# EAGLE design EC_AMPLIFIER_BENCHTOP_V.1.1.1 (EAGLE 9.6.2)
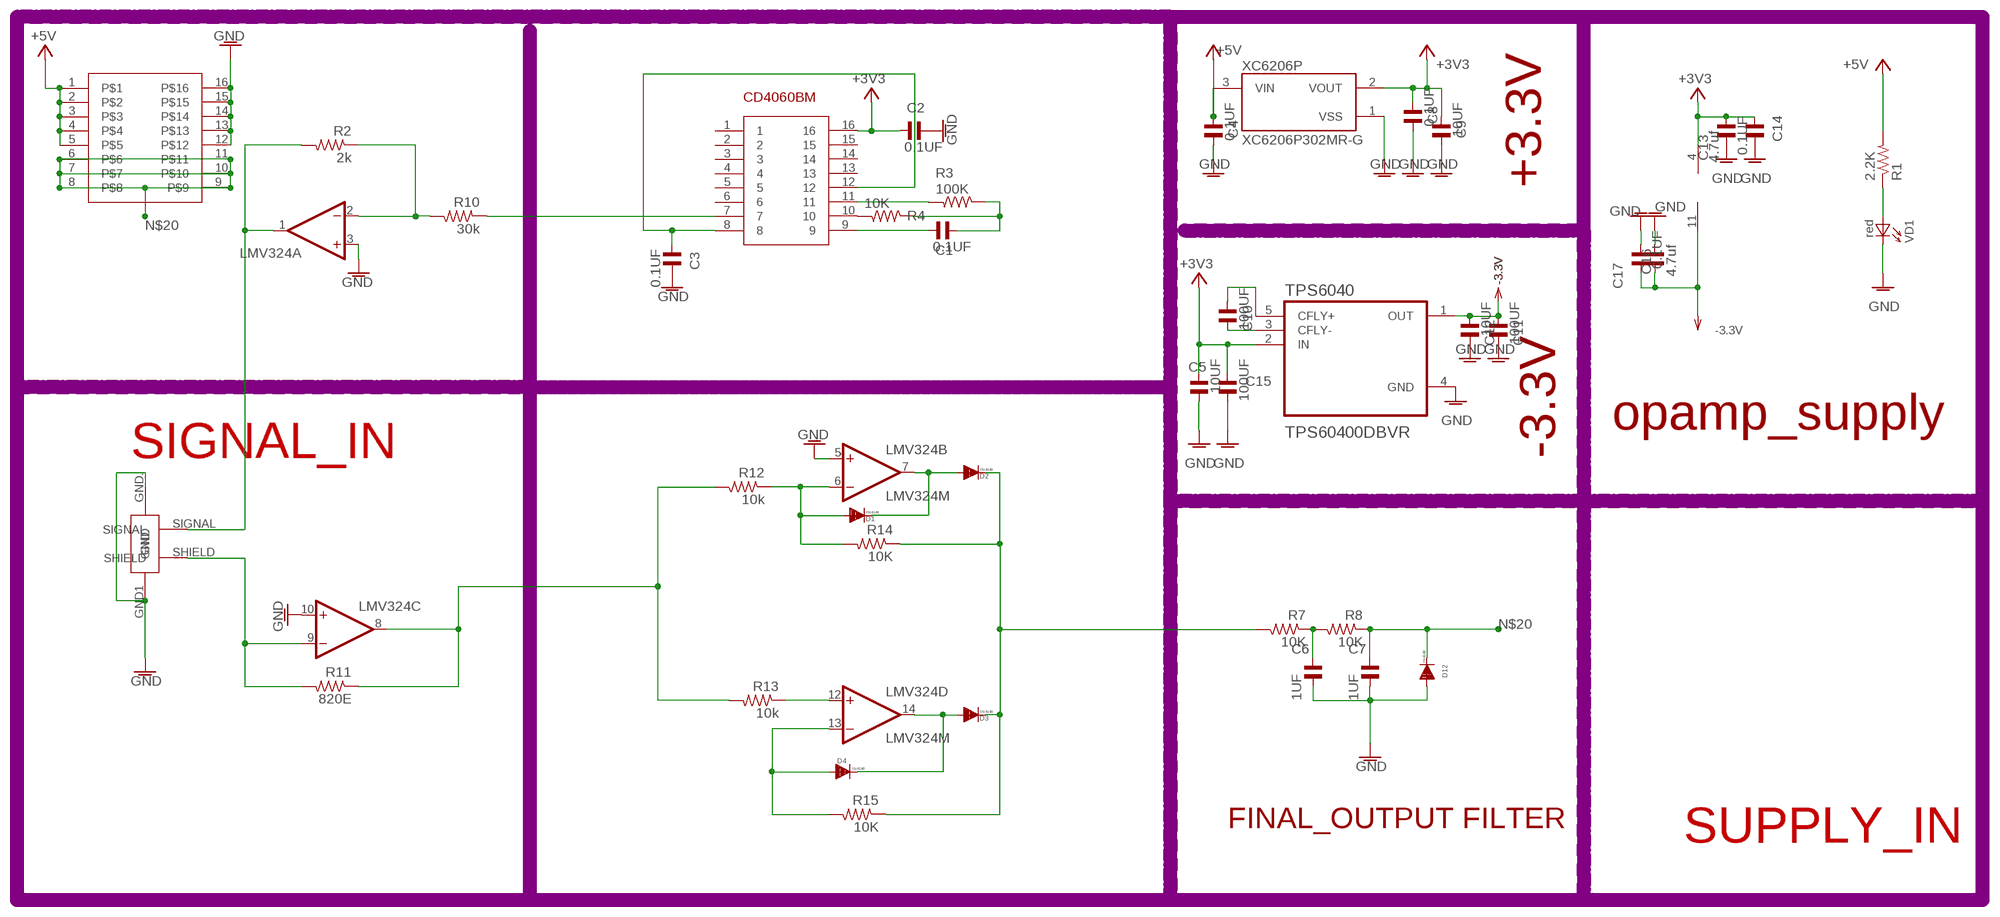
[diagram p0: schematic, sheet 1]

## Parts
C1  0.1UF  C-USC0805K  [C0805K]
C2  0.1UF  C-USC0805K  [C0805K]
C3  0.1UF  C-USC0805K  [C0805K]
C4  0.1UF  C-USC0805K  [C0805K]
C5  10UF  C-USC0805K  [C0805K]
C6  1UF  C-USC0805K  [C0805K]
C7  1UF  C-USC0805K  [C0805K]
C8  0.1UF  C-USC0805K  [C0805K]
C9  10UF  C-USC0805K  [C0805K]
C10  100UF  C-USC0805K  [C0805K]
C11  100UF  C-USC0805K  [C0805K]
C12  10UF  C-USC0805K  [C0805K]
C13  4.7uf  C-USC0805K  [C0805K]
C14  0.1UF  C-USC0805K  [C0805K]
C15  100UF  C-USC0805K  [C0805K]
C16  4.7uf  C-USC0805K  [C0805K]
C17  0.1UF  C-USC0805K  [C0805K]
CD4060BM  CD4060BM  [SOIC-16]
D1  IN4148  DIODE80  [SOD-80]
D2  IN4148  DIODE80  [SOD-80]
D3  IN4148  DIODE80  [SOD-80]
D4  IN4148  DIODE80  [SOD-80]
D12  IN4148  DIODE80  [SOD-80]
LMV324  LMV324M  [SO14]
R1  2.2K  R-US_M0805  [M0805]
R2  2k  R-US_M0805  [M0805]
R3  100K  R-US_M0805  [M0805]
R4  10K  R-US_M0805  [M0805]
R7  10K  R-US_M0805  [M0805]
R8  10K  R-US_M0805  [M0805]
R10  30k  R-US_M0805  [M0805]
R11  820E  R-US_M0805  [M0805]
R12  10k  R-US_M0805  [M0805]
R13  10k  R-US_M0805  [M0805]
R14  10K  R-US_M0805  [M0805]
R15  10K  R-US_M0805  [M0805]
TPS6040  TPS60400DBVR  [SOT95P280X145-5N]
U$2  AMPLIFIER_BENCHTOP  [AMPLIFIER_BENCHTOP]
U$3  BNC_RIGHTANGLE  [BNC_RIGHTANGLE]
VD1  red  LED1206  [LED-1206]
XC6206P  XC6206P302MR-G  [SOT95P280X130-3N]

## Nets
+3V3: C2.1 C5.2 C8.2 C9.2 C13.2 C14.2 C15.2 CD4060BM.16 LMV324.4(P:V+) TPS6040.2(IN) XC6206P.2(VOUT)
+5V: C4.2 R1.2 U$2.1 U$2.2 U$2.3 U$2.4 U$2.5 XC6206P.3(VIN)
-5V: C11.2 C12.2 C16.1 C17.1 LMV324.11(P:V-) TPS6040.1(OUT) ; supply symbol labelled -3.3V
GNDA: C2.2 C3.2 C4.1 C5.1 C6.2 C7.2 C8.1 C9.1 C11.1 C12.1 C13.1 C14.1 C15.1 C16.2 C17.2 D12.A LMV324.3(A:+IN) LMV324.5(B:+IN) LMV324.10(C:+IN) TPS6040.4(GND) U$2.12 U$2.13 U$2.14 U$2.15 U$2.16 U$3.GND1(GND.) U$3.GND.(GND) VD1.C XC6206P.1(VSS) ; supply symbol labelled GND
N$1: LMV324.2(A:-IN) R2.1 R10.2
N$2: C10.2 TPS6040.5(CFLY+)
N$3: C10.1 TPS6040.3(CFLY-)
N$4: C6.1 R7.1 R8.2
N$5: C3.1 CD4060BM.8 CD4060BM.12
N$6: CD4060BM.7 R10.1
N$7: CD4060BM.11 R3.1
N$8: R1.1 VD1.A
N$9: CD4060BM.10 R4.1
N$10: LMV324.9(C:-IN) R11.2 U$3.SHIELD
N$14: LMV324.8(C:OUT) R11.1 R12.2 R13.2
N$15: C1.1 CD4060BM.9
N$16: C1.2 R3.2 R4.2
N$17: LMV324.1(A:OUT) R2.2 U$3.SIGNAL
N$18: D1.A LMV324.6(B:-IN) R12.1 R14.2
N$19: LMV324.12(D:+IN) R13.1
N$20: C7.1 D12.K R8.1 U$2.6 U$2.7 U$2.8 U$2.9 U$2.10 U$2.11
N$21: D1.K D2.A LMV324.7(B:OUT)
N$22: D4.A LMV324.13(D:-IN) R15.2
N$23: D3.A D4.K LMV324.14(D:OUT)
N$25: D2.K D3.K R7.2 R14.1 R15.1
Unconnected: CD4060BM.1 CD4060BM.2 CD4060BM.3 CD4060BM.4 CD4060BM.5 CD4060BM.6 CD4060BM.13 CD4060BM.14 CD4060BM.15

## Notes on the sheet
- +3.3V
- opamp_supply
- SIGNAL_IN | -3.3V
- FINAL_OUTPUT FILTER
- SUPPLY_IN

## Library data of the parts
C1-C17 = rcl:C-US: CAPACITOR, American symbol
CD4060BM = Squadron:CD4060BM
D1-D4 D12 = Squadron:DIODE
LMV324 = linear:LMV324?*: Quad General Purpose, Low Voltage, Rail-to-Rail Output Operational Amplifiers Source: http://www.national.com/mpf/LM/LMV321.html http://www.national.com/dt/lmv_qual.pdf
R1-R4 R7 R8 R10-R15 = rcl:R-US_: RESISTOR, American symbol
TPS6040 = TPS60400DBVR:TPS60400DBVR
U$2 = Squadron:AMPLIFIER_BENCHTOP
U$3 = Squadron:BNC_RIGHTANGLE
VD1 = led:LED: LEDs SMD Leds
XC6206P = XC6206P302MR-G:XC6206P302MR-G: Linear Voltage Regulator IC 1 Output 200mA SOT-23; MANUFACTURER: Torex; MAXIMUM_PACKAGE_HEIGHT: 1.3mm; PARTREV: N/A; STANDARD: IPC-7351B

## Board
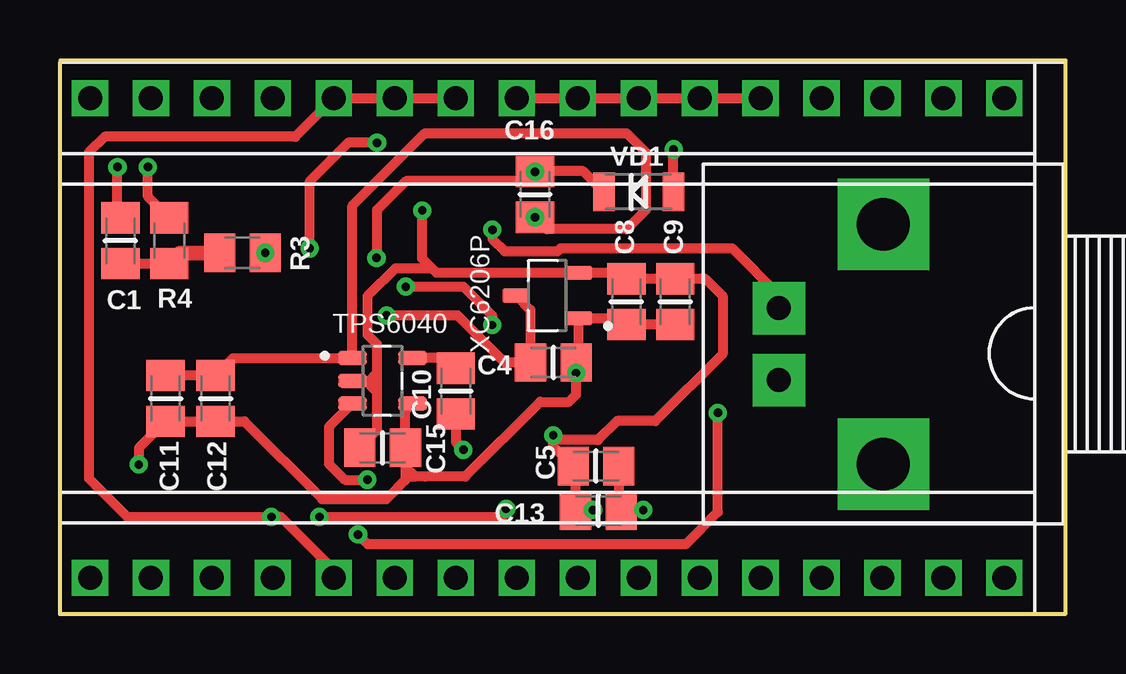
[diagram p1: board, top side]
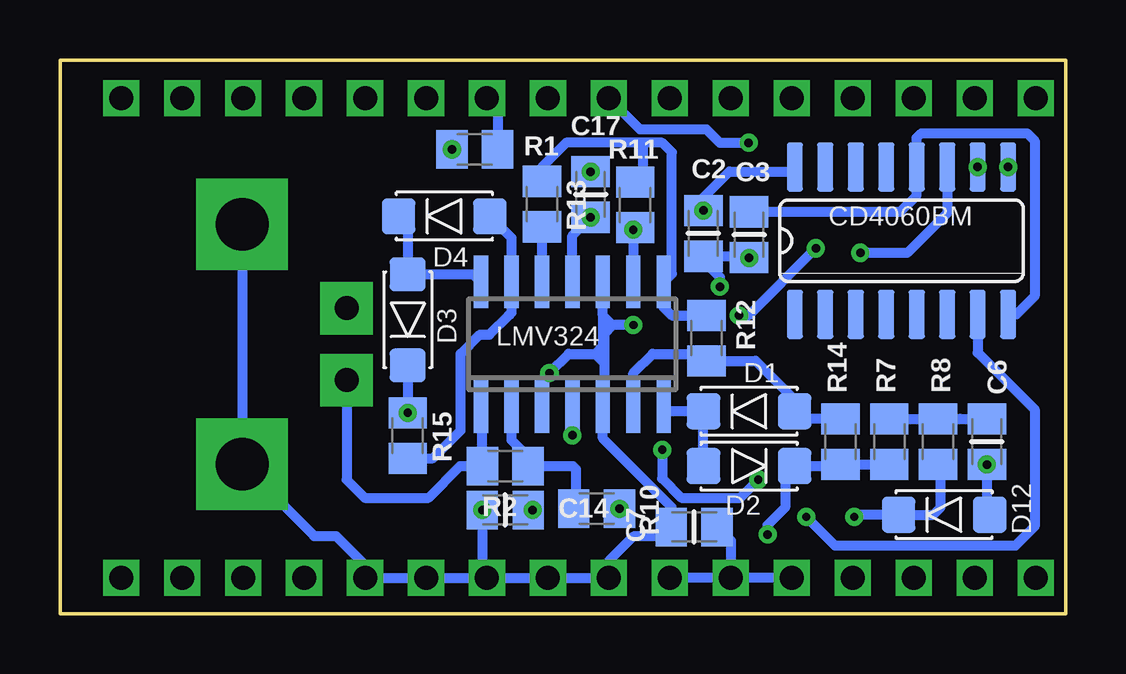
[diagram p2: board, bottom side, seen from below]

Size 41.9 x 23.1 mm. Coordinates in mm from the lower left corner, seen from the top.
Copper layers (1*16): Top 0.035mm / dielectric 1.5mm / Bottom 0.035mm
Design rules "default *": minimum track width 6mil, minimum drill 0.35mm, track to track 10mil, track to pad 10mil, pad to pad 10mil, via to via 10mil, smd to smd 10mil, copper to edge 40mil, drill to drill 10mil, minimum pad ring 10mil, minimum via ring 8mil, stop-mask expansion 4mil, vias tented up to drill 0mil, thermal gap 10mil

### Footprints (pad centres in the part's own frame; a part is rotated, then mirrored left to right if it is on the bottom)
C0805K = smd 1.3 x 1.6: 1 -0.953,0; 2 0.953,0
SOIC-16 = smd 0.66 x 2.032: 1 -4.445,-3.073; 2 -3.175,-3.073; 3 -1.905,-3.073; 4 -0.635,-3.073; 5 0.635,-3.073; 6 1.905,-3.073; 7 3.175,-3.073; 8 4.445,-3.073; 9 4.445,3.073; 10 3.175,3.073; 11 1.905,3.073; 12 0.635,3.073; 13 -0.635,3.073; 14 -1.905,3.073; 15 -3.175,3.073; 16 -4.445,3.073
SOD-80 = smd 1.4 x 1.5: A -1.9,0; K 1.9,0
SO14 = smd 0.6 x 2.2: 1 -3.81,-2.6; 2 -2.54,-2.6; 3 -1.27,-2.6; 4 0,-2.6; 5 1.27,-2.6; 6 2.54,-2.6; 7 3.81,-2.6; 8 3.81,2.6; 9 2.54,2.6; 10 1.27,2.6; 11 0,2.6; 12 -1.27,2.6; 13 -2.54,2.6; 14 -3.81,2.6
M0805 = smd 1.3 x 1.6: 1 -0.95,0; 2 0.95,0
SOT95P280X145-5N = smd 1.21 x 0.59: 1 -1.255,0.95; 2 -1.255,0; 3 -1.255,-0.95; 4 1.255,-0.95; 5 1.255,0.95
AMPLIFIER_BENCHTOP = drill 1 square: 1 -10,8.89; 2 -10,6.35; 3 -10,3.81; 4 -10,1.27; 5 -10,-1.27; 6 -10,-3.81; 7 -10,-6.35; 8 -10,-8.89; 9 10,-8.89; 10 10,-6.35; 11 10,-3.81; 12 10,-1.27; 13 10,1.27; 14 10,3.81; 15 10,6.35; 16 10,8.89; 17 -10,11.43; 18 -10,13.97; 19 -10,16.51; 20 -10,19.05; 21 10,11.43; 22 10,13.97; 23 10,16.51; 24 10,19.05; 25 10,-11.43; 26 10,-13.97; 27 10,-16.51; 28 10,-19.05; 29 -10,-11.43; 30 -10,-13.97; 31 -10,-16.51; 32 -10,-19.05
BNC_RIGHTANGLE = drill 2.2 pad 3.81 square: GND1 -5,0; GND. 5,0 | drill 1 pad 2.184 square: SHIELD 1.5,4.35; SIGNAL -1.5,4.35
LED-1206 = smd 0.9 x 1.6: A -1.45,0; C 1.45,0
SOT95P280X130-3N = smd 1.12 x 0.6: 1 -1.3,0.95; 2 -1.3,-0.95; 3 1.3,0

### Placement (x,y rotation side)
C1  2.52,15.56 270 top
C2  15.09,15.87 270 bottom
C3  13.19,15.82 270 bottom
C4  20.55,10.48 180 top
C5  22.33,6.17 180 top
C6  3.28,7.18 270 bottom
C7  15.47,3.63 180 bottom
C8  23.6,13.02 90 top
C9  25.63,13.02 90 top
C10  16.49,9.29 90 top
C11  4.4,8.99 90 top
C12  6.48,8.99 90 top
C13  22.43,4.31 180 top
C14  23.35,4.34 0 bottom
C15  13.44,6.93 180 top
C16  19.79,17.49 90 top
C17  19.79,17.49 90 bottom
CD4060BM  6.84,15.56 0 bottom
D1  13.19,8.45 180 bottom
D2  13.19,6.17 0 bottom
D3  27.41,12.26 270 bottom
D4  25.89,16.58 180 bottom
D12  5.06,4.13 180 bottom
LMV324  20.55,11.25 0 bottom
R1  24.62,19.37 0 bottom
R2  23.35,6.17 180 bottom
R3  7.6,15.06 180 top
R4  4.55,15.56 270 top
R7  7.35,7.18 270 bottom
R8  5.31,7.18 90 bottom
R10  19.54,4.39 180 bottom
R11  17.93,17.05 270 bottom
R12  14.97,11.5 90 bottom
R13  21.82,17.09 90 bottom
R14  9.38,7.18 90 bottom
R15  27.41,7.44 270 bottom
TPS6040  13.44,9.72 0 top
U$2  20.3,11.5 270 top
U$3  34.31,11.25 90 top
VD1  24.11,17.6 180 top
XC6206P  20.3,13.28 180 top

### Tracks (layer width: path | path; a pad name or v marks a point on that pad's centre or on a via)
+3V3  (via drill 0.35)
  Top 0.406: 20.55,7.25 20.55,6.99 C5.2 21.48,6.06 C13.2 21.51,4.34 v22.2,4.34 | 20.55,7.25 v20.55,7.45 | 24.01,13.98 C8.2 23.35,14.23 | 24.01,13.98 C9.2 26.88,13.98 27.61,13.25 27.61,10.85 24.81,8.05 23.21,8.05 22.41,7.25 20.55,7.25 | 15.49,14.42 15.69,14.23 XC6206P.2 23.76,14.23 24.01,13.98 | 15.49,14.42 15.09,14.82 C2.1 | 15.49,14.42 13.98,14.42 12.81,13.25 12.81,11.65 13.21,11.25 13.21,10.05 | C15.2 13.21,7.65 13.21,9.25 | 13.21,10.05 13.21,9.65 | 13.21,9.65 13.21,9.25 | TPS6040.2 13.13,9.72 13.21,9.65 | TPS6040.2 12.73,9.72 13.21,9.25 | TPS6040.2 12.88,9.72 13.21,10.05
  Bottom 0.406: CD4060BM.16 11.47,18.45 14.01,18.45 15.09,17.36 C2.1 | LMV324.4 v20.55,7.45 | v22.2,4.34 C14.2
  other vias: 15.09,16.82
+5V  (via drill 0.35)
  Top 0.406: XC6206P.3 19.6,12.68 C4.2 18.53,10.48 16.57,12.45 v13.61,12.45 | U$2.5 U$2.4 U$2.3 U$2.2 U$2.1 | v10.41,15.25 10.41,18.05 12.01,19.65 v13.21,19.65
  Bottom 0.406: R1.2 23.67,21.06 U$2.3 | U$2.5 17.73,20.2 14.97,20.2 14.41,19.65 v13.21,19.65 | v13.61,12.45 13.21,12.45 v10.41,15.25
-5V  (via drill 0.35)
  Top 0.406: C11.2 C12.2 7.22,10.67 TPS6040.1 12.19,17.02 15.21,20.05 23.61,20.05 24.41,19.25 24.41,16.85 23.61,16.05 20.28,16.05 C16.1
  Bottom 0.406: LMV324.11 20.55,15.77 C16.1
  other vias: 19.79,16.54
GNDA  (via drill 0.35)
  Top 0.406: 14.39,5.58 13.61,4.8 10.92,4.8 7.68,8.03 C12.1 C11.1 3.28,6.92 C6.2 | C15.1 14.39,5.58 | C15.1 14.39,7.25 | 14.39,7.25 14.39,8.47 TPS6040.4 | C5.1 23.29,4.41 C13.1 23.41,4.34 C14.1 | 21.51,9.35 v21.51,10.05 | v21.51,10.05 C4.1 21.6,10.58 XC6206P.1 23.35,12.33 C8.1 C9.1 | 14.39,7.24 14.39,7.25 | C17.2 19.82,18.46 21.79,18.46 VD1.C | C17.2 20.01,18.23 | C17.2 19.4,18.05 14.41,18.05 13.21,16.85 13.21,14.87 v13.19,14.85 | v14.41,13.65 16.81,13.65 18.01,12.45 v18.01,12.05 | 14.79,5.73 15.21,5.73 16.89,5.73 20.01,8.85 21.21,8.85 21.51,9.14 v21.51,10.05 | C15.1 14.39,6.13 14.79,5.73 | 14.39,5.58 14.54,5.73 14.79,5.73
  Bottom 0.406: C7.2 16.82,3.23 18.01,3.23 19.03,2.21 19.03,1.65 | 19.03,1.65 U$2.12 | C7.2 16.43,4.03 | C6.2 3.28,4.12 2.81,3.65 2.81,3.78 D12.A | LMV324.3 21.82,9.73 v21.51,10.05 20.71,10.85 19.61,10.85 | 19.28,12.45 LMV324.10 | 19.28,12.45 19.28,12.05 | 19.28,12.05 19.28,11.65 | 19.28,11.65 19.28,11.17 | 19.61,10.85 19.28,11.17 | 19.61,10.85 19.28,10.52 | 19.21,10.45 19.21,8.72 LMV324.5 19.28,7.32 16.43,4.46 C7.2 | v13.19,14.85 C3.2 13.24,14.92 C2.2 15.19,14.82 14.41,14.05 v14.41,13.65 | 24.01,1.5 U$2.14 U$2.15 U$2.16 29.19,2.03 30.41,3.25 31.31,3.25 U$3.GND1 U$3.GND. | 24.01,1.5 U$2.13 19.18,1.5 19.03,1.65 | C14.1 24.3,1.79 24.01,1.5 | v18.01,12.05 18.88,12.05 | 18.88,12.05 19.28,12.05 | 19.28,12.45 18.88,12.05 | 19.21,11.72 19.28,11.65 | 19.28,11.17 19.28,10.52 | 19.28,10.52 19.21,10.45 | 19.21,10.45 19.21,11.72 | 19.21,11.72 18.88,12.05
  other vias: 3.28,6.23 24.3,4.34 19.79,18.44
N$1
  Bottom 0.406: R2.1 22.01,6.17 | 22.01,6.17 20.53,6.17 20.41,6.05 20.41,4.47 R10.2 | LMV324.2 23.09,7.25 22.01,6.17
N$2
  Top 0.406: C10.2 16.06,10.67 TPS6040.5
N$3  (via drill 0.35)
  Top 0.406: TPS6040.3 11.21,7.79 11.21,6.26 11.87,5.6 v12.81,5.6 | C10.1 16.49,7.16 v16.81,6.85
  Bottom 0.406: v12.81,5.6 13.56,4.85 16.01,4.85 16.81,5.65 v16.81,6.85
N$4
  Bottom 0.406: R7.1 R8.2 4.41,8.13 C6.1
N$5
  Bottom 0.406: 2.38,12.51 2.41,12.51 | CD4060BM.8 2.38,12.51 | 2.38,12.51 2.04,12.51 1.29,13.25 1.29,19.73 1.61,20.05 6.01,20.05 6.2,19.85 CD4060BM.12 6.2,17.45 6.88,16.77 C3.1
N$6  (via drill 0.35)
  Top 0.406: R10.1 18.59,4.23 18.41,4.05 v10.81,4.05
  Bottom 0.406: CD4060BM.7 3.66,10.9 1.29,8.53 1.29,3.65 2.09,2.85 9.61,2.85 v10.81,4.05
  other vias: 18.59,4.39
N$7  (via drill 0.35)
  Bottom 0.406: CD4060BM.11 4.93,16.72 6.6,15.06 R3.1
  other vias: 8.55,15.06 8.55,15.06
N$8  (via drill 0.35)
  Top 0.406: VD1.A R1.1
  other vias: 25.57,19.37
N$9  (via drill 0.35)
  Top 0.406: R4.1 3.66,17.4 CD4060BM.10
  other vias: 3.66,18.64
N$10  (via drill 0.35)
  Top 0.406: v18.01,16.02 18.01,15.64 18.52,15.13 20.74,15.13 20.86,15.25 28.01,15.25 29.96,13.3 U$3.SHIELD
  Bottom 0.406: LMV324.9 v18.01,16.02 R11.2
N$14
  Bottom 0.406: R12.2 16.41,12.45 16.74,12.78 LMV324.8 16.41,14.18 16.41,19.25 16.81,19.65 17.61,19.65 | R13.2 21.82,18.63 20.81,19.65 17.61,19.65 | R11.1 17.61,18.33 17.61,19.65
N$15  (via drill 0.35)
  Top 0.406: C1.1 2.39,16.64 CD4060BM.9
  other vias: 2.39,18.64
N$16
  Top 0.406: C1.2 R4.2
  Top 0.61: R4.2 4.99,15.06 R3.2
N$17
  Bottom 0.406: LMV324.1 24.3,8.58 R2.2 25.23,6.17 26.55,4.85 29.21,4.85 29.96,5.6 U$3.SIGNAL
N$18
  Bottom 0.406: R14.2 10.97,8.13 D1.A 11.29,8.93 12.91,10.55 R12.1 15.26,10.85 17.21,10.85 18.01,10.04 LMV324.6
N$19
  Bottom 0.406: R13.1 LMV324.12
N$20  (via drill 0.35)
  Top 0.406: U$2.9 11.41,1.84 9.21,4.05 v8.81,4.05 2.81,4.05 1.21,5.65 1.21,19.25 1.86,19.9 9.81,19.9 U$2.8 U$2.7 U$2.6
  Bottom 0.406: R8.1 5.21,6.13 5.21,4.45 5.52,4.13 D12.K 8.72,4.13 v8.81,4.05 | C7.1 13.95,3.05 U$2.10 | U$2.9 U$2.10 | U$2.10 U$2.11
N$21
  Bottom 0.406: D2.A D1.K 16.55,8.45 LMV324.7
N$22
  Bottom 0.406: R15.2 26.37,6.49 25.21,7.65 25.21,10.85 24.41,11.65 24.01,11.65 23.21,12.45 23.09,12.56 LMV324.13 23.09,15.69 D4.A
N$23
  Bottom 0.406: LMV324.14 24.68,14.16 D3.A 27.41,16.2 D4.K
N$25  (via drill 0.35)
  Top 0.406: v12.42,3.31 12.82,2.91 26.07,2.91 27.41,4.25 R15.1
  Bottom 0.406: R7.2 R14.1 9.44,6.17 D2.K 11.69,5.77 11.69,4.44 12.42,3.71 v12.42,3.31 | D3.K R15.1
  other vias: 27.41,8.39